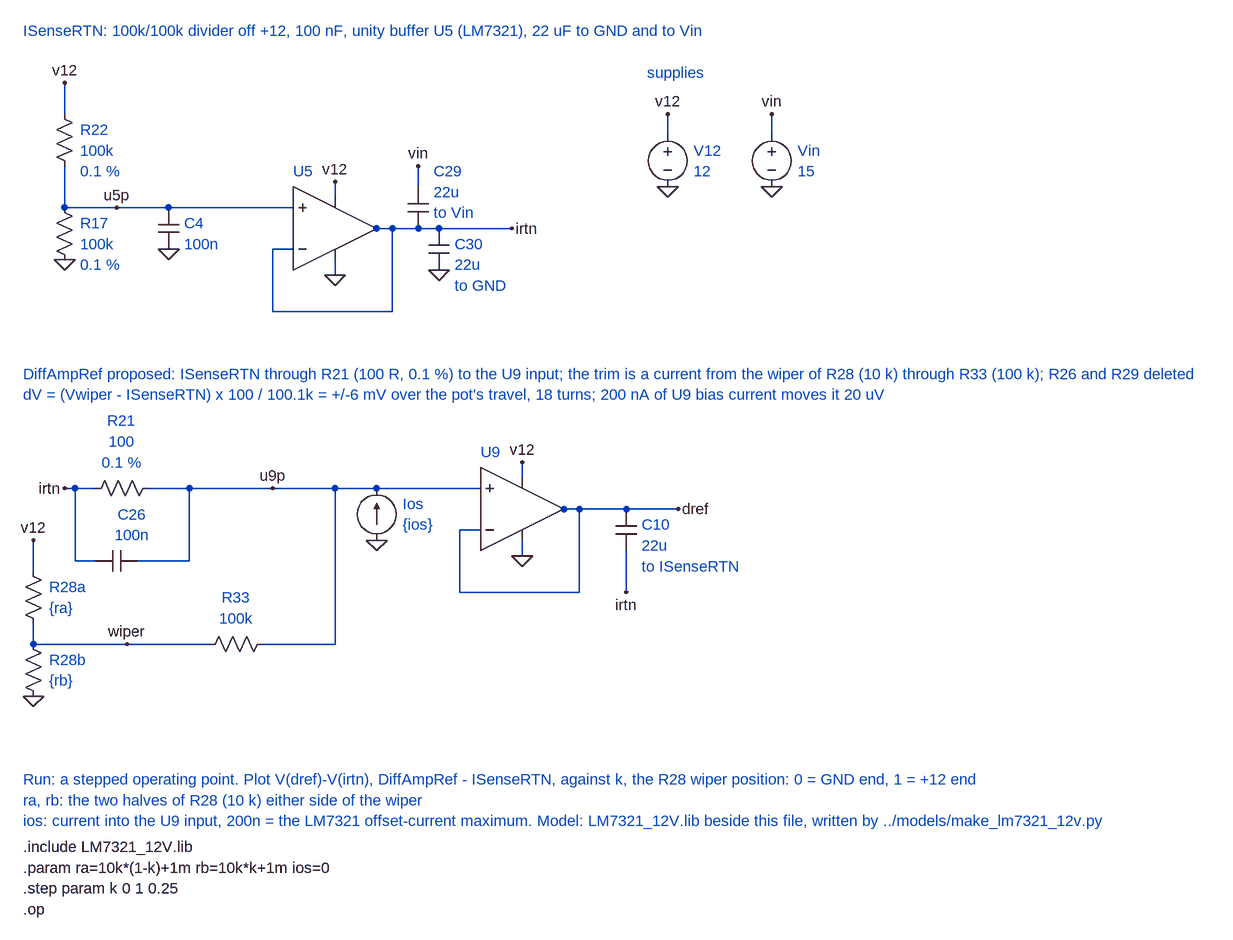
[diagram p0: schematic ref_proposed.asc]
ref_proposed.asc, the LTspice schematic file:
Version 4
SHEET 1 2400 1500
TEXT 48 96 Left 2 ;ISenseRTN: 100k/100k divider off +12, 100 nF, unity buffer U5 (LM7321), 22 uF to GND and to Vin
WIRE 112 176 112 224
FLAG 112 176 v12
SYMBOL res 96 208 R0
WINDOW 0 0 0 Invisible 2
WINDOW 3 0 0 Invisible 2
SYMATTR InstName R22
SYMATTR Value 100k
TEXT 136 248 Left 2 ;R22
TEXT 136 280 Left 2 ;100k
TEXT 136 312 Left 2 ;0.1 %
WIRE 112 304 112 368
SYMBOL res 96 352 R0
WINDOW 0 0 0 Invisible 2
WINDOW 3 0 0 Invisible 2
SYMATTR InstName R17
SYMATTR Value 100k
TEXT 136 392 Left 2 ;R17
TEXT 136 424 Left 2 ;100k
TEXT 136 456 Left 2 ;0.1 %
FLAG 112 448 0
WIRE 112 368 272 368
WIRE 272 368 464 368
FLAG 192 368 u5p
SYMBOL cap 256 368 R0
WINDOW 0 0 0 Invisible 2
WINDOW 3 0 0 Invisible 2
SYMATTR InstName C4
SYMATTR Value 100n
TEXT 296 392 Left 2 ;C4
TEXT 296 424 Left 2 ;100n
FLAG 272 432 0
SYMBOL LM7321_12V 464 336 R0
WINDOW 0 0 0 Invisible 2
WINDOW 3 0 0 Invisible 2
SYMATTR InstName U5
TEXT 464 312 Left 2 ;U5
WIRE 464 432 432 432
WIRE 432 432 432 528
WIRE 432 528 616 528
WIRE 616 528 616 400
WIRE 616 400 592 400
WIRE 528 352 528 328
FLAG 528 328 v12
WIRE 528 448 528 472
FLAG 528 472 0
WIRE 592 400 656 400
WIRE 656 400 688 400
WIRE 688 400 800 400
FLAG 800 400 irtn
SYMBOL cap 640 336 R0
WINDOW 0 0 0 Invisible 2
WINDOW 3 0 0 Invisible 2
SYMATTR InstName C29
SYMATTR Value 22u
TEXT 680 312 Left 2 ;C29
TEXT 680 344 Left 2 ;22u
TEXT 680 376 Left 2 ;to Vin
WIRE 656 336 656 304
FLAG 656 304 vin
SYMBOL cap 672 400 R0
WINDOW 0 0 0 Invisible 2
WINDOW 3 0 0 Invisible 2
SYMATTR InstName C30
SYMATTR Value 22u
TEXT 712 424 Left 2 ;C30
TEXT 712 456 Left 2 ;22u
TEXT 712 488 Left 2 ;to GND
FLAG 688 464 0
TEXT 1008 160 Left 2 ;supplies
WIRE 1040 224 1040 256
FLAG 1040 224 v12
SYMBOL voltage 1040 240 R0
WINDOW 0 0 0 Invisible 2
WINDOW 3 0 0 Invisible 2
SYMATTR InstName V12
SYMATTR Value 12
TEXT 1080 280 Left 2 ;V12
TEXT 1080 312 Left 2 ;12
FLAG 1040 336 0
WIRE 1200 224 1200 256
FLAG 1200 224 vin
SYMBOL voltage 1200 240 R0
WINDOW 0 0 0 Invisible 2
WINDOW 3 0 0 Invisible 2
SYMATTR InstName Vin
SYMATTR Value 15
TEXT 1240 280 Left 2 ;Vin
TEXT 1240 312 Left 2 ;15
FLAG 1200 336 0
TEXT 48 624 Left 2 ;DiffAmpRef proposed: ISenseRTN through R21 (100 R, 0.1 %) to the U9 input; the trim is a current from the wiper of R28 (10 k) through R33 (100 k); R26 and R29 deleted
TEXT 48 656 Left 2 ;dV = (Vwiper - ISenseRTN) x 100 / 100.1k = +/-6 mV over the pot's travel, 18 turns; 200 nA of U9 bias current moves it 20 uV
WIRE 112 800 128 800
WIRE 128 800 160 800
FLAG 112 800 irtn
SYMBOL res 144 816 R270
WINDOW 0 0 0 Invisible 2
WINDOW 3 0 0 Invisible 2
SYMATTR InstName R21
SYMATTR Value 100
TEXT 200 696 Center 2 ;R21
TEXT 200 728 Center 2 ;100
TEXT 200 760 Center 2 ;0.1 %
WIRE 240 800 304 800
WIRE 304 800 528 800
WIRE 528 800 592 800
WIRE 592 800 752 800
FLAG 432 800 u9p
WIRE 128 800 128 912
WIRE 128 912 160 912
SYMBOL cap 160 928 R270
WINDOW 0 0 0 Invisible 2
WINDOW 3 0 0 Invisible 2
SYMATTR InstName C26
SYMATTR Value 100n
TEXT 216 840 Center 2 ;C26
TEXT 216 872 Center 2 ;100n
WIRE 224 912 304 912
WIRE 304 912 304 800
WIRE 64 880 64 928
FLAG 64 880 v12
SYMBOL res 48 912 R0
WINDOW 0 0 0 Invisible 2
WINDOW 3 0 0 Invisible 2
SYMATTR InstName R28a
SYMATTR Value {ra}
TEXT 88 952 Left 2 ;R28a
TEXT 88 984 Left 2 ;{ra}
WIRE 64 1008 64 1040
WIRE 64 1040 336 1040
FLAG 208 1040 wiper
SYMBOL res 48 1024 R0
WINDOW 0 0 0 Invisible 2
WINDOW 3 0 0 Invisible 2
SYMATTR InstName R28b
SYMATTR Value {rb}
TEXT 88 1064 Left 2 ;R28b
TEXT 88 1096 Left 2 ;{rb}
FLAG 64 1120 0
SYMBOL res 320 1056 R270
WINDOW 0 0 0 Invisible 2
WINDOW 3 0 0 Invisible 2
SYMATTR InstName R33
SYMATTR Value 100k
TEXT 376 968 Center 2 ;R33
TEXT 376 1000 Center 2 ;100k
WIRE 416 1040 528 1040
WIRE 528 1040 528 800
SYMBOL current 592 880 R180
WINDOW 0 0 0 Invisible 2
WINDOW 3 0 0 Invisible 2
SYMATTR InstName Ios
SYMATTR Value {ios}
TEXT 632 824 Left 2 ;Ios
TEXT 632 856 Left 2 ;{ios}
FLAG 592 880 0
SYMBOL LM7321_12V 752 768 R0
WINDOW 0 0 0 Invisible 2
WINDOW 3 0 0 Invisible 2
SYMATTR InstName U9
TEXT 752 744 Left 2 ;U9
WIRE 752 864 720 864
WIRE 720 864 720 960
WIRE 720 960 904 960
WIRE 904 960 904 832
WIRE 904 832 880 832
WIRE 816 784 816 760
FLAG 816 760 v12
WIRE 816 880 816 904
FLAG 816 904 0
WIRE 880 832 976 832
WIRE 976 832 1056 832
FLAG 1056 832 dref
SYMBOL cap 960 832 R0
WINDOW 0 0 0 Invisible 2
WINDOW 3 0 0 Invisible 2
SYMATTR InstName C10
SYMATTR Value 22u
TEXT 1000 856 Left 2 ;C10
TEXT 1000 888 Left 2 ;22u
TEXT 1000 920 Left 2 ;to ISenseRTN
WIRE 976 896 976 960
FLAG 976 960 irtn
TEXT 48 1248 Left 2 ;Run: a stepped operating point. Plot V(dref)-V(irtn), DiffAmpRef - ISenseRTN, against k, the R28 wiper position: 0 = GND end, 1 = +12 end
TEXT 48 1280 Left 2 ;ra, rb: the two halves of R28 (10 k) either side of the wiper
TEXT 48 1312 Left 2 ;ios: current into the U9 input, 200n = the LM7321 offset-current maximum. Model: LM7321_12V.lib beside this file, written by ../models/make_lm7321_12v.py
TEXT 48 1352 Left 2 !.include LM7321_12V.lib
TEXT 48 1384 Left 2 !.param ra=10k*(1-k)+1m rb=10k*k+1m ios=0
TEXT 48 1416 Left 2 !.step param k 0 1 0.25
TEXT 48 1448 Left 2 !.op

The netlist it stands for:
* ref_proposed.asc
R22 v12 u5p 100k
R17 u5p 0 100k
C4 u5p 0 100n
XU5 u5p irtn v12 0 irtn LM7321_12V  ; pins IN+ IN- V+ V- OUT
C29 vin irtn 22u
C30 irtn 0 22u
V12 v12 0 12
Vin vin 0 15
R21 irtn u9p 100
C26 irtn u9p 100n
R28a v12 wiper {ra}
R28b wiper 0 {rb}
R33 wiper u9p 100k
Ios 0 u9p {ios}
XU9 u9p dref v12 0 dref LM7321_12V  ; pins IN+ IN- V+ V- OUT
C10 dref irtn 22u
* ISenseRTN: 100k/100k divider off +12, 100 nF, unity buffer U5 (LM7321), 22 uF to GND and to Vin
* R22
* 100k
* 0.1 %
* R17
* 100k
* 0.1 %
* C4
* 100n
* U5
* C29
* 22u
* to Vin
* C30
* 22u
* to GND
* supplies
* V12
* 12
* Vin
* 15
* DiffAmpRef proposed: ISenseRTN through R21 (100 R, 0.1 %) to the U9 input; the trim is a current from the wiper of R28 (10 k) through R33 (100 k); R26 and R29 deleted
* dV = (Vwiper - ISenseRTN) x 100 / 100.1k = +/-6 mV over the pot's travel, 18 turns; 200 nA of U9 bias current moves it 20 uV
* R21
* 100
* 0.1 %
* C26
* 100n
* R28a
* {ra}
* R28b
* {rb}
* R33
* 100k
* Ios
* {ios}
* U9
* C10
* 22u
* to ISenseRTN
* Run: a stepped operating point. Plot V(dref)-V(irtn), DiffAmpRef - ISenseRTN, against k, the R28 wiper position: 0 = GND end, 1 = +12 end
* ra, rb: the two halves of R28 (10 k) either side of the wiper
* ios: current into the U9 input, 200n = the LM7321 offset-current maximum. Model: LM7321_12V.lib beside this file, written by ../models/make_lm7321_12v.py
.include LM7321_12V.lib
.param ra=10k*(1-k)+1m rb=10k*k+1m ios=0
.step param k 0 1 0.25
.op
.backanno
.end